# Altium project PCB_Project -1.PrjPcb
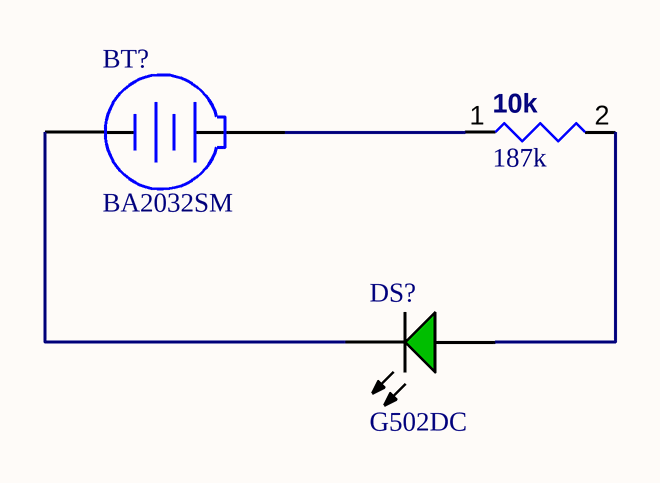
[diagram p0: Sheet1 p-1.SchDoc]
1 sheet, 3 parts. Net scope: global (net labels, ports and power ports of the same name join across sheets).
Board file: PCB1 p-1.PcbDoc

## Sheet Sheet1 p-1.SchDoc
size A; SheetNumber: 1; SheetTotal: 1

### Parts
10k  value 187k  [RESC0402(1005)_L]  (hidden comment: Resistor 187K +/-1 % 0402 63 mW)
BT?  BA2032SM  [MPD-BA2032SM_V]
DS?  G502DC  [CGX-G502DC]

### Nets
Net10k_1: 10k.1 BT?.1(+)
Net10k_2: 10k.2 DS?.1(A)
NetBT?_2: BT?.2(-) DS?.2(K)

### Library data of the parts
10k = CMP-009-00170-3: Chip Resistor, 187 kOhms, +/-1 %, 63 mW, -55 to 155 degC, 0402; Power: 63mW; Tolerance: 1%; Case/Package: 0402; Min Operating Temperature: -55°C; Pins: 2; Max Operating Temperature: 155°C
BT? = CMP-002-00003-2: Coin Cell Holder, 1 Cell, -40 to 225 degC, 2-Pin SMD, RoHS, Tray; Manufacturer: Memory Protection Devices; Connector Type: BatteryHolder; Package Quantity: 100; Package Description: 2-Pin Surface Mount Device, Body 28 x 16 mm; Datasheet Version: Rev. H, 03/2014; RoHS Compliant: True; Case/Package: BA2032SM; Mounting Technology: SM; Min Operating Temperature: -40°C; Package Reference: BA2032SM; Max Operating Temperature: 225°C; Datasheet URL: http://www.onlinecomponents.com/datasheet/ba2032sm.aspx?p=11910700
DS? = CMP-007-00008-2: Green LED, 80 mW, 20 mA, -25 to 85 degC, 2-Pin THD; Manufacturer: Shenzhen CGX; Mounting Technology: TH; Package Reference: G502DC; Datasheet Version: Sep-14; Manufacturer URL: http://szcgx.com/; Package Description: 2-Pin Through Hole Device, Dia 5.9 mm; Datasheet URL: http://datasheet.octopart.com/G502DC-Chengguangxing-datasheet-62330340.pdf; Case/Package: G502DC; RoHS Compliant: Unknown